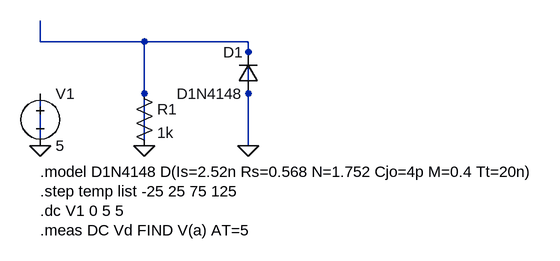
[diagram p0: schematic Ex11.asc]
Ex11.asc, the LTspice schematic file:
Version 4
SHEET 1 1680 1080
WIRE 80 160 80 128
WIRE 240 160 80 160
WIRE 400 160 240 160
WIRE 400 240 400 160
WIRE 240 240 240 160
WIRE 80 320 80 240
WIRE 240 320 240 240
WIRE 400 320 400 240
FLAG 80 320 0
FLAG 240 320 0
FLAG 400 320 0
SYMBOL voltage 80 224 R0
WINDOW 123 0 0 Left 0
WINDOW 39 0 0 Left 0
SYMATTR InstName V1
SYMATTR Value 5
SYMBOL res 224 224 R0
SYMATTR InstName R1
SYMATTR Value 1k
SYMBOL diode 416 240 R180
WINDOW 0 24 64 Left 2
WINDOW 3 24 0 Left 2
SYMATTR InstName D1
SYMATTR Value D1N4148
NET 240 160 in
NET 400 160 a
TEXT 80 360 Left 2 !.model D1N4148 D(Is=2.52n Rs=0.568 N=1.752 Cjo=4p M=0.4 Tt=20n)
TEXT 80 390 Left 2 !.step temp list -25 25 75 125
TEXT 80 420 Left 2 !.dc V1 0 5 5
TEXT 80 450 Left 2 !.meas DC Vd FIND V(a) AT=5

The netlist it stands for:
* Ex11.asc
V1 0 0 5
R1 0 0 1k
D1 0 0 D1N4148
.model D D
.lib standard.dio
.model D1N4148 D(Is=2.52n Rs=0.568 N=1.752 Cjo=4p M=0.4 Tt=20n)
.step temp list -25 25 75 125
.dc V1 0 5 5
.meas DC Vd FIND V(a) AT=5
.backanno
.end